# Altium schematic sheet 02_PMIC.SchDoc
size 508 x 381 mm; SheetNumber: 2; SheetTotal: 16
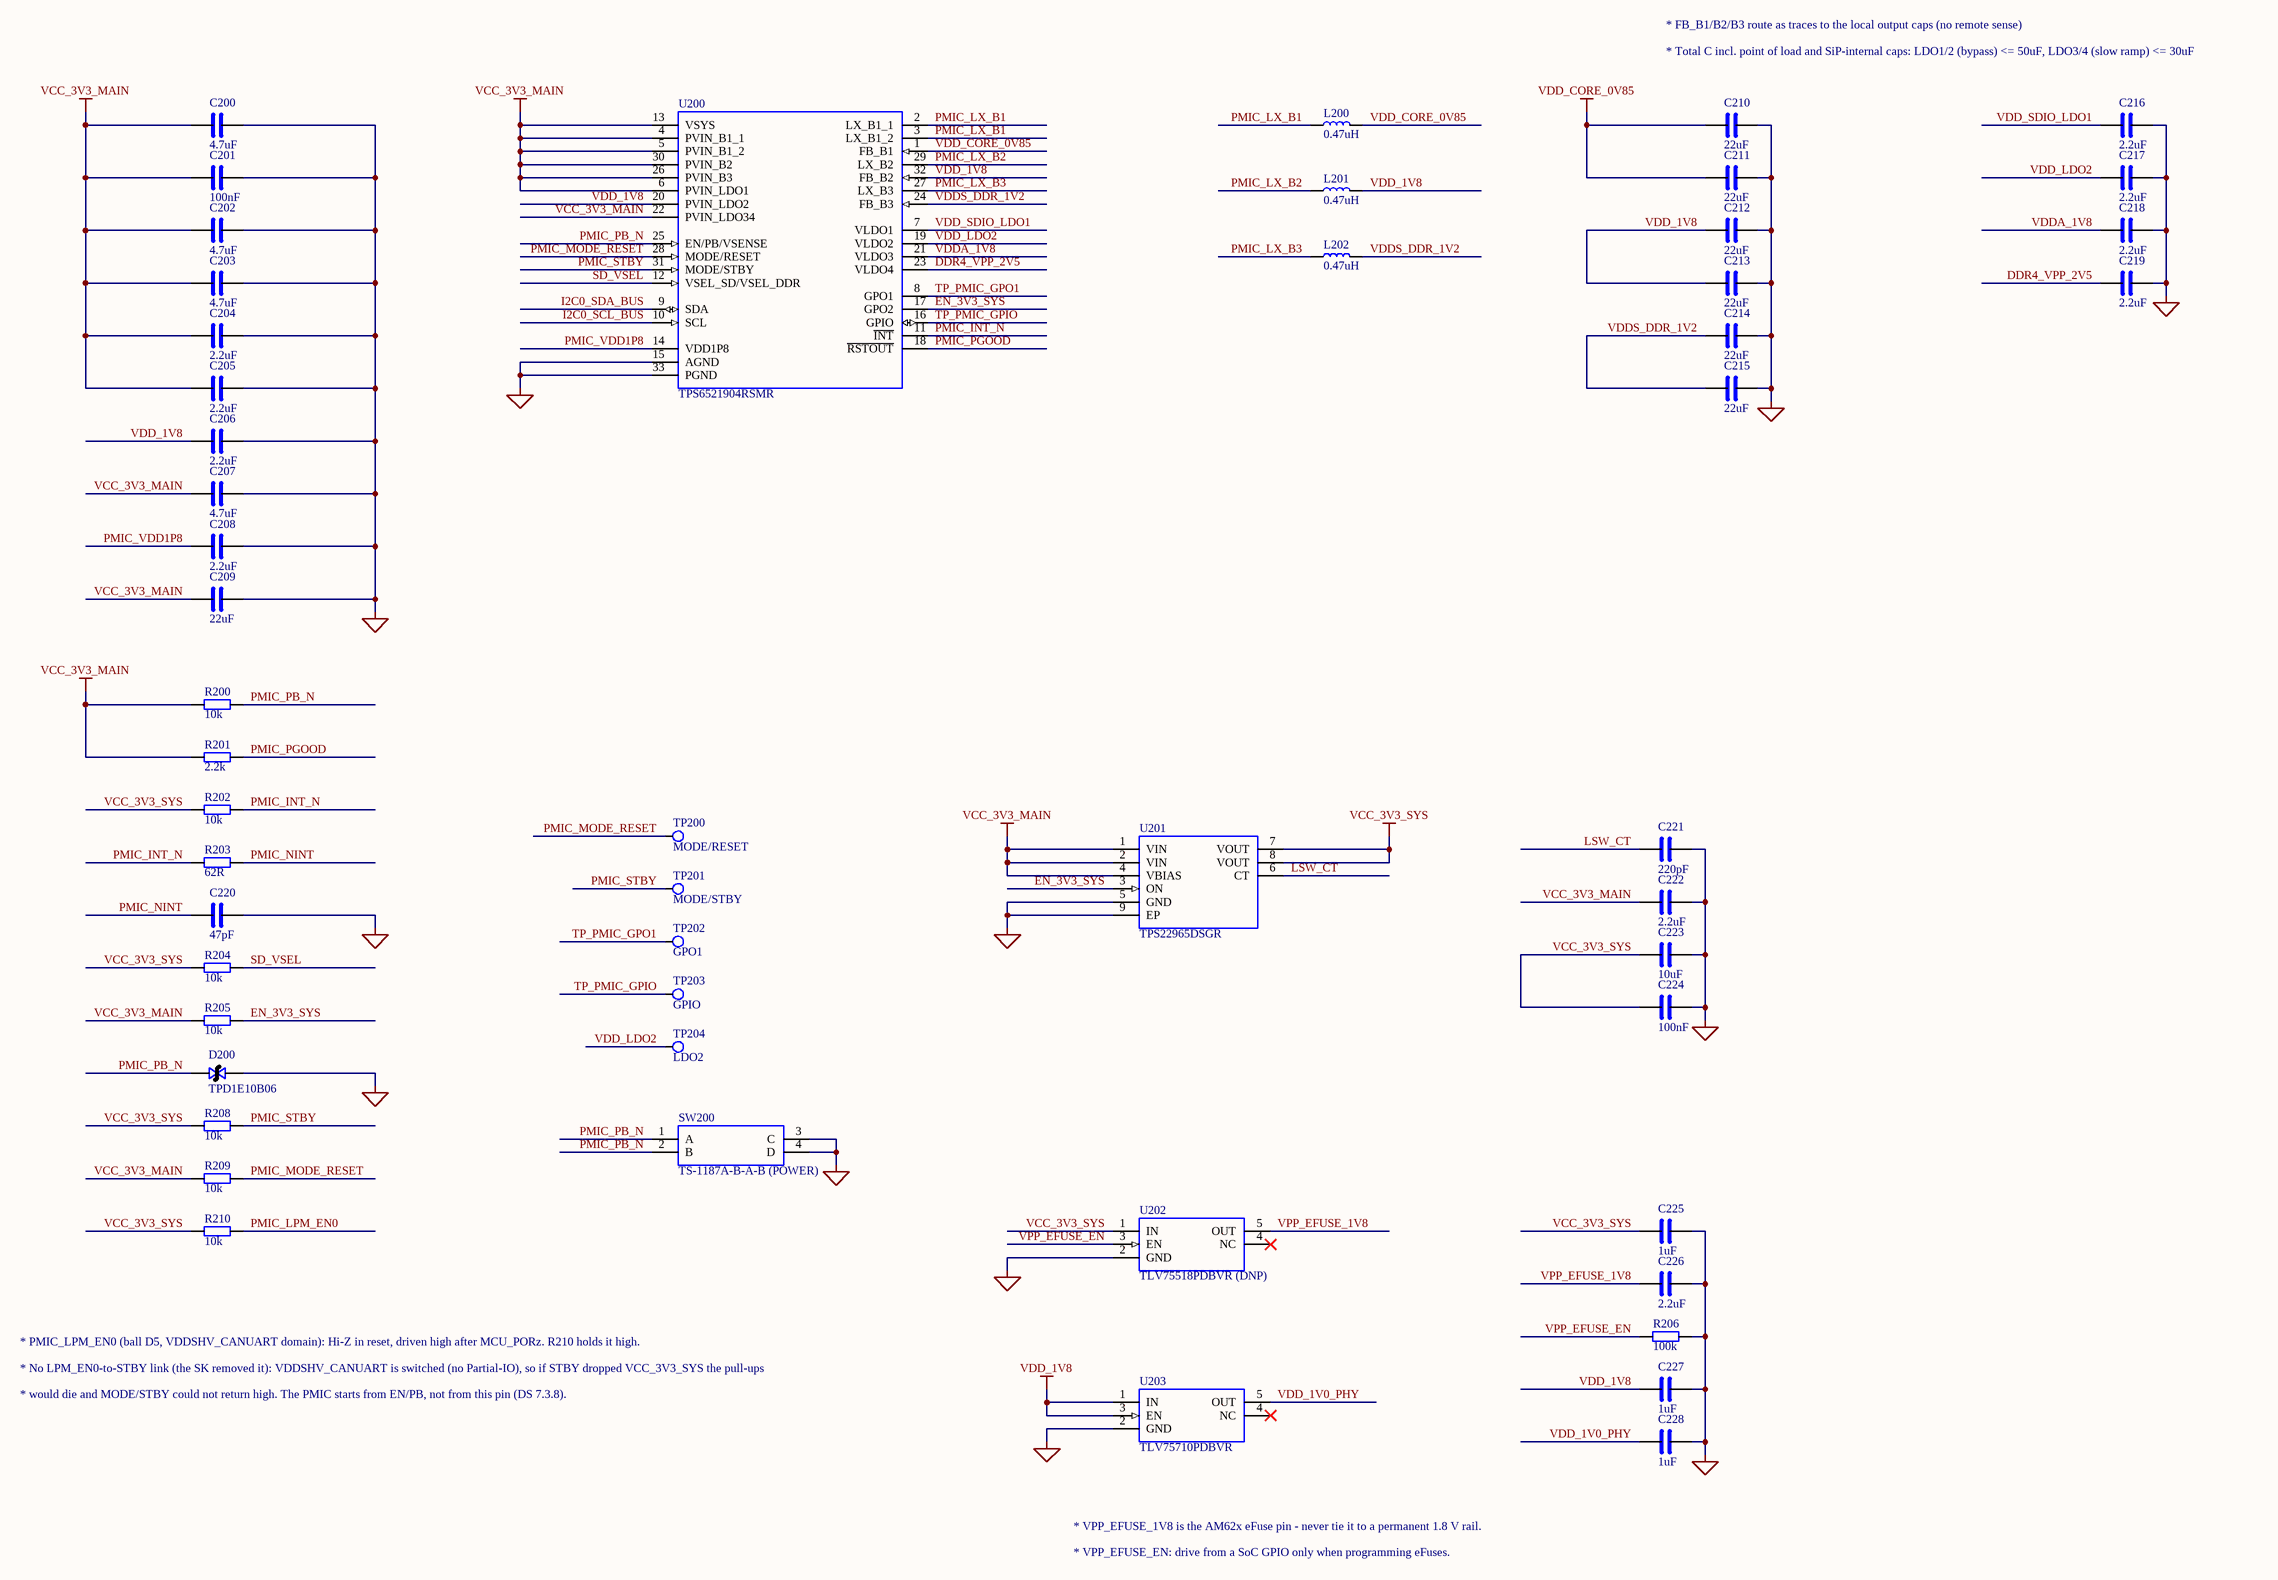
[diagram p0: 02_PMIC.SchDoc]

## Parts
C200  4.7uF  [C0603]
C201  100nF  [C0402]
C202  4.7uF  [C0603]
C203  4.7uF  [C0603]
C204  2.2uF  [C0402]
C205  2.2uF  [C0402]
C206  2.2uF  [C0402]
C207  4.7uF  [C0603]
C208  2.2uF  [C0402]
C209  22uF  [C0805]
C210  22uF  [C0805]
C211  22uF  [C0805]
C212  22uF  [C0805]
C213  22uF  [C0805]
C214  22uF  [C0805]
C215  22uF  [C0805]
C216  2.2uF  [C0402]
C217  2.2uF  [C0402]
C218  2.2uF  [C0402]
C219  2.2uF  [C0402]
C220  47pF  [C0402]
C221  220pF  [C0402]
C222  2.2uF  [C0402]
C223  10uF  [C0603]
C224  100nF  [C0402]
C225  1uF  [C0402]
C226  2.2uF  [C0402]
C227  1uF  [C0402]
C228  1uF  [C0402]
D200  TPD1E10B06  [X1SON2_DPY]
L200  0.47uH  [IND_MURATA_DFE252012F]
L201  0.47uH  [IND_MURATA_DFE252012F]
L202  0.47uH  [IND_MURATA_DFE252012F]
R200  10k  [R0402]
R201  2.2k  [R0402]
R202  10k  [R0402]
R203  62R  [R0402]
R204  10k  [R0402]
R205  10k  [R0402]
R206  100k  [R0402]
R208  10k  [R0402]
R209  10k  [R0402]
R210  10k  [R0402]
SW200  TS-1187A-B-A-B (POWER)  [SW_TACT_5.1X5.1_SMD4]
TP200  MODE/RESET  [TP_PAD_1.0]
TP201  MODE/STBY  [TP_PAD_1.0]
TP202  GPO1  [TP_PAD_1.0]
TP203  GPIO  [TP_PAD_1.0]
TP204  LDO2  [TP_PAD_1.0]
U200  TPS6521904RSMR  [VQFN32_RSM_4X4]
U201  TPS22965DSGR  [WSON8_DSG_2X2]
U202  TLV75518PDBVR (DNP)  [SOT23-5]
U203  TLV75710PDBVR  [SOT23-5]

## Nets
GND: C200.2 C201.2 C202.2 C203.2 C204.2 C205.2 C206.2 C207.2 C208.2 C209.2 C210.2 C211.2 C212.2 C213.2 C214.2 C215.2 C216.2 C217.2 C218.2 C219.2 C220.2 C221.2 C222.2 C223.2 C224.2 C225.2 C226.2 C227.2 C228.2 D200.2 R206.2 SW200.3(C) SW200.4(D) U200.15(AGND) U200.33(PGND) U201.5(GND) U201.9(EP) U202.2(GND) U203.2(GND)
VCC_3V3_MAIN: C200.1 C201.1 C202.1 C203.1 C204.1 C205.1 C207.1 C209.1 C222.1 R200.1 R201.1 R205.1 R209.1 U200.4(PVIN_B1_1) U200.5(PVIN_B1_2) U200.6(PVIN_LDO1) U200.13(VSYS) U200.22(PVIN_LDO34) U200.26(PVIN_B3) U200.30(PVIN_B2) U201.1(VIN) U201.2(VIN) U201.4(VBIAS)
VCC_3V3_SYS: C223.1 C224.1 C225.1 R202.1 R204.1 R208.1 R210.1 U201.7(VOUT) U201.8(VOUT) U202.1(IN)
VDD_1V8: C206.1 C212.1 C213.1 C227.1 L201.2 U200.20(PVIN_LDO2) U200.32(FB_B2) U203.1(IN) U203.3(EN)
VDD_CORE_0V85: C210.1 C211.1 L200.2 U200.1(FB_B1)
DDR4_VPP_2V5: C219.1 U200.23(VLDO4)
EN_3V3_SYS: R205.2 U200.17(GPO2) U201.3(ON)
I2C0_SCL_BUS: U200.10(SCL)
I2C0_SDA_BUS: U200.9(SDA)
LSW_CT: C221.1 U201.6(CT)
PMIC_INT_N: R202.2 R203.1 U200.11(~{INT})
PMIC_LPM_EN0: R210.2
PMIC_LX_B1: L200.1 U200.2(LX_B1_1) U200.3(LX_B1_2)
PMIC_LX_B2: L201.1 U200.29(LX_B2)
PMIC_LX_B3: L202.1 U200.27(LX_B3)
PMIC_MODE_RESET: R209.2 TP200.1(TP) U200.28(MODE/RESET)
PMIC_NINT: C220.1 R203.2
PMIC_PB_N: D200.1 R200.2 SW200.1(A) SW200.2(B) U200.25(EN/PB/VSENSE)
PMIC_PGOOD: R201.2 U200.18(~{RSTOUT})
PMIC_STBY: R208.2 TP201.1(TP) U200.31(MODE/STBY)
PMIC_VDD1P8: C208.1 U200.14(VDD1P8)
SD_VSEL: R204.2 U200.12(VSEL_SD/VSEL_DDR)
TP_PMIC_GPIO: TP203.1(TP) U200.16(GPIO)
TP_PMIC_GPO1: TP202.1(TP) U200.8(GPO1)
VDD_1V0_PHY: C228.1 U203.5(OUT)
VDD_LDO2: C217.1 TP204.1(TP) U200.19(VLDO2)
VDD_SDIO_LDO1: C216.1 U200.7(VLDO1)
VDDA_1V8: C218.1 U200.21(VLDO3)
VDDS_DDR_1V2: C214.1 C215.1 L202.2 U200.24(FB_B3)
VPP_EFUSE_1V8: C226.1 U202.5(OUT)
VPP_EFUSE_EN: R206.1 U202.3(EN)

Not connected (* = marked no-connect by the designer): U202 4(NC)*; U203 4(NC)*

## Notes on the sheet
- * FB_B1/B2/B3 route as traces to the local output caps (no remote sense)
- * Total C incl. point of load and SiP-internal caps: LDO1/2 (bypass) <= 50uF, LDO3/4 (slow ramp) <= 30uF
- * PMIC_LPM_EN0 (ball D5, VDDSHV_CANUART domain): Hi-Z in reset, driven high after MCU_PORz. R210 holds it high.
- * No LPM_EN0-to-STBY link (the SK removed it): VDDSHV_CANUART is switched (no Partial-IO), so if STBY dropped VCC_3V3_SYS the pull-ups
- * would die and MODE/STBY could not return high. The PMIC starts from EN/PB, not from this pin (DS 7.3.8).
- * VPP_EFUSE_1V8 is the AM62x eFuse pin - never tie it to a permanent 1.8 V rail.
- * VPP_EFUSE_EN: drive from a SoC GPIO only when programming eFuses.

## Library data of the parts
C200 = CAP: Capacitor, non-polarized; Spec: 4.7uF 10V X5R 0603 (PVIN_B1)
C201 = CAP: Capacitor, non-polarized; Spec: 100nF 16V X7R 0402 (PVIN_B1)
C202 = CAP: Capacitor, non-polarized; Spec: 4.7uF 10V X5R 0603 (PVIN_B2)
C203 = CAP: Capacitor, non-polarized; Spec: 4.7uF 10V X5R 0603 (PVIN_B3)
C204 = CAP: Capacitor, non-polarized; Spec: 2.2uF 10V X5R 0402 (VSYS)
C205 = CAP: Capacitor, non-polarized; Spec: 2.2uF 10V X5R 0402 (PVIN_LDO1)
C206 = CAP: Capacitor, non-polarized; Spec: 2.2uF 10V X5R 0402 (PVIN_LDO2)
C207 = CAP: Capacitor, non-polarized; Spec: 4.7uF 10V X5R 0603 (PVIN_LDO34)
C208 = CAP: Capacitor, non-polarized; Spec: 2.2uF 10V X5R 0402 (VDD1P8, no load)
C209 = CAP: Capacitor, non-polarized; Spec: 22uF 6.3V X5R 0805 (bulk)
C210 C211 = CAP: Capacitor, non-polarized; Spec: 22uF 6.3V X5R 0805 (Buck1 out)
C212 C213 = CAP: Capacitor, non-polarized; Spec: 22uF 6.3V X5R 0805 (Buck2 out)
C214 C215 = CAP: Capacitor, non-polarized; Spec: 22uF 6.3V X5R 0805 (Buck3 out)
C216 = CAP: Capacitor, non-polarized; Spec: 2.2uF 10V X5R 0402 (LDO1 out)
C217 = CAP: Capacitor, non-polarized; Spec: 2.2uF 10V X5R 0402 (LDO2 out, unused)
C218 = CAP: Capacitor, non-polarized; Spec: 2.2uF 10V X5R 0402 (LDO3 out)
C219 = CAP: Capacitor, non-polarized; Spec: 2.2uF 10V X5R 0402 (LDO4 out)
C220 = CAP: Capacitor, non-polarized; Spec: 47pF 50V C0G 0402
C221 = CAP: Capacitor, non-polarized; Spec: 220pF 50V C0G 0402 (CT: IO supply slew)
C222 = CAP: Capacitor, non-polarized; Spec: 2.2uF 10V X5R 0402 (VIN)
C223 = CAP: Capacitor, non-polarized; Spec: 10uF 10V X5R 0603 (VOUT)
C224 = CAP: Capacitor, non-polarized; Spec: 100nF 16V X7R 0402 (VOUT)
C225 = CAP: Capacitor, non-polarized; DNP: 1; Spec: 1uF 10V X5R 0402 (VPP LDO in, DNP)
C226 = CAP: Capacitor, non-polarized; DNP: 1; Spec: 2.2uF 10V X5R 0402 (VPP LDO out, DNP)
C227 = CAP: Capacitor, non-polarized; Spec: 1uF 10V X5R 0402 (PHY LDO in)
C228 = CAP: Capacitor, non-polarized; Spec: 1uF 10V X5R 0402 (PHY LDO out)
D200 = TVS_BI: Bidirectional TVS / ESD diode; Spec: TPD1E10B06 ESD
L200 = IND: Inductor; MPN: DFE252012F-R47M=P2; Manufacturer: Murata; Spec: 0.47uH DFE252012F-R47M (Buck1, Isat 6.7A)
L201 = IND: Inductor; MPN: DFE252012F-R47M=P2; Manufacturer: Murata; Spec: 0.47uH DFE252012F-R47M (Buck2)
L202 = IND: Inductor; MPN: DFE252012F-R47M=P2; Manufacturer: Murata; Spec: 0.47uH DFE252012F-R47M (Buck3)
R200 R202 = RES: Resistor; Spec: 10k 0402
R201 = RES: Resistor; Spec: 2.2k 0402 (fast edge into the MCU_PORz gate, sheet 06)
R203 = RES: Resistor; Spec: 62R 0402 (slew limiter, SK rev B)
R204 = RES: Resistor; Spec: 10k 0402 (SD starts at 3.3 V)
R205 = RES: Resistor; Spec: 10k 0402 (GPO2 is open drain)
R206 = RES: Resistor; Spec: 100k 0402 (keeps VPP off)
R208 = RES: Resistor; Spec: 10k 0402 (MODE/STBY high = ACTIVE + forced PWM, SK R621)
R209 = RES: Resistor; Spec: 10k 0402 (MODE/RESET high = no reset)
R210 = RES: Resistor; Spec: 10k 0402 (Octavo 62_CONFIG_9: to the VDDSHV_CANUART source)
SW200 = TS-1187A: Tactile switch SPST-NO 5.1x5.1 mm, 4 terminals (A=B, C=D); Manufacturer: XKB Connection; MPN: TS-1187A-B-A-B
TP200-TP204 = TESTPOINT: Test point
U200 = TPS65219: TPS65219 PMIC, 3 bucks + 4 LDOs, VQFN-32 RHB/RSM (NVM per OPN); Manufacturer: Texas Instruments; MPN: TPS6521904RSMR
U201 = TPS22965_DSG: TPS22965 5.7 V 4 A load switch with controlled rise time, WSON-8; Manufacturer: Texas Instruments; MPN: TPS22965DSGR
U202 = TLV755P_DBV: TLV755P 500 mA LDO, SOT-23-5 (fixed output per OPN); Manufacturer: Texas Instruments; DNP: 1; MPN: TLV75518PDBVR
U203 = TLV755P_DBV: TLV755P 500 mA LDO, SOT-23-5 (fixed output per OPN); Manufacturer: Texas Instruments; MPN: TLV75710PDBVR